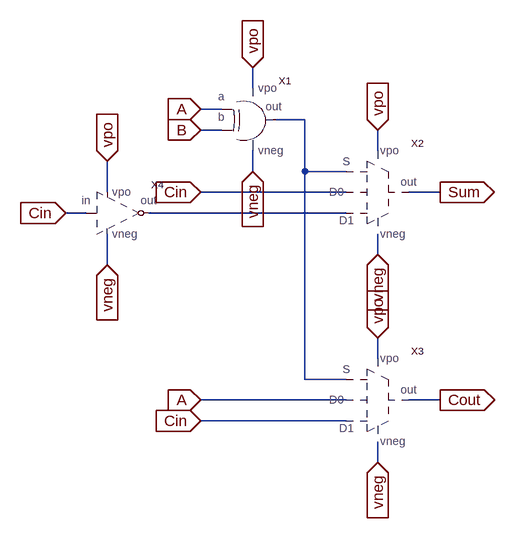
[diagram p0: schematic FullAdder.asc]
FullAdder.asc, the LTspice schematic file:
Version 4
SHEET 1 880 804
WIRE 384 128 384 96
WIRE 336 160 304 160
WIRE 464 176 416 176
WIRE 336 192 304 192
WIRE 576 224 576 192
WIRE 384 256 384 224
WIRE 464 256 464 176
WIRE 528 256 464 256
WIRE 160 288 160 240
WIRE 528 288 304 288
WIRE 672 288 624 288
WIRE 128 320 96 320
WIRE 528 320 224 320
WIRE 576 384 576 352
WIRE 160 400 160 352
WIRE 576 544 576 512
WIRE 464 576 464 256
WIRE 528 576 464 576
WIRE 528 608 304 608
WIRE 672 608 624 608
WIRE 528 640 304 640
WIRE 576 704 576 672
FLAG 384 96 vpo
IOPIN 384 96 In
FLAG 576 192 vpo
IOPIN 576 192 In
FLAG 576 512 vpo
IOPIN 576 512 In
FLAG 672 288 Sum
IOPIN 672 288 Out
FLAG 672 608 Cout
IOPIN 672 608 Out
FLAG 384 256 vneg
IOPIN 384 256 In
FLAG 576 384 vneg
IOPIN 576 384 In
FLAG 576 704 vneg
IOPIN 576 704 In
FLAG 96 320 Cin
IOPIN 96 320 In
FLAG 160 240 vpo
IOPIN 160 240 In
FLAG 160 400 vneg
IOPIN 160 400 In
FLAG 304 288 Cin
IOPIN 304 288 In
FLAG 304 608 A
IOPIN 304 608 In
FLAG 304 640 Cin
IOPIN 304 640 In
FLAG 304 160 A
IOPIN 304 160 In
FLAG 304 192 B
IOPIN 304 192 In
SYMBOL XOR 368 176 R0
SYMATTR InstName X1
SYMBOL Multiplexer 576 288 R0
SYMATTR InstName X2
SYMBOL Multiplexer 576 608 R0
SYMATTR InstName X3
SYMBOL Inverter 160 320 R0
SYMATTR InstName X4

The netlist it stands for:
* FullAdder.asc
XX1 N001 A B vneg vpo XOR  ; pins out a b vneg vpo
XX2 vpo vneg N002 Cin N001 Sum Multiplexer  ; pins vpo vneg D1 D0 S out
XX3 vpo vneg Cin A N001 Cout Multiplexer  ; pins vpo vneg D1 D0 S out
XX4 Cin N002 vpo vneg Inverter  ; pins in out vpo vneg
.backanno
.end